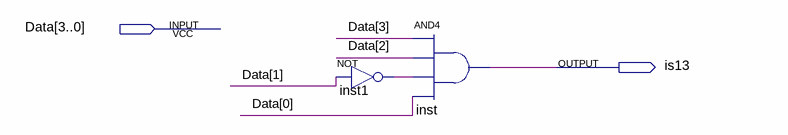
[diagram p0: schematic sheet]
// Quartus schematic check13.bdf as structural Verilog: 2 symbols, 2 pins
module check13 (
  input  [3:0] Data,
  output is13
);

  wire inst1_out;

  not inst1 (inst1_out, Data[1]);
  and inst (is13, Data[3], Data[2], inst1_out, Data[0]);
endmodule
